# Altium schematic sheet 14V_Buck.SchDoc
size A; Author: Jared Ainsworth; CompanyName: UpRev LLC; Engineer: Jared Ainsworth; Organization: UpRev LLC; Address1: 4807 Commercial Park Dr.; Address2: Austin, TX 78724; Address3: United States; Address4: www.UpRev.com; SheetNumber: 12; SheetTotal: 13
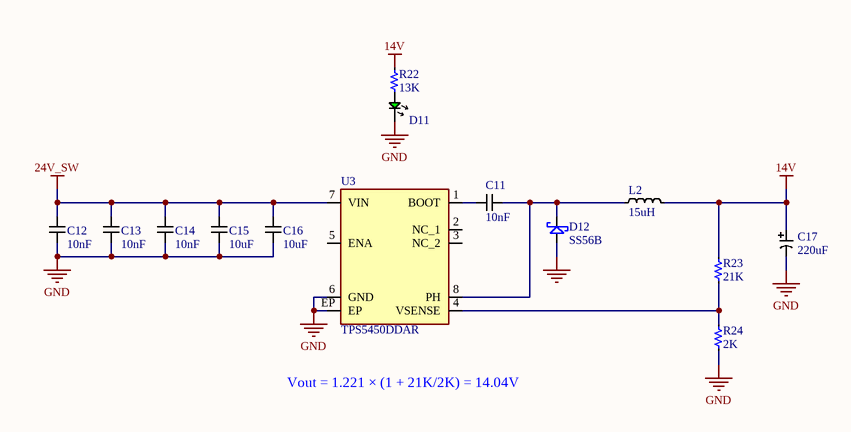
[diagram p0: 14V_Buck.SchDoc]

## Parts
C11  10nF  [C0402 (1005)]
C12  10nF  [C0402 (1005)]
C13  10nF  [C0402 (1005)]
C14  10nF  [C0402 (1005)]
C15  10uF  [C1206 (3216)]
C16  10uF  [C1206 (3216)]
C17  220uF  [Cap D10xL10.2mm]
D11  Green  [LED Green 0402 (1005)]  (value not drawn)
D12  SS56B  [DO-214AA]
L2  15uH  [Inductor 11.5x10mm SMD]
R22  13K  [R0402 (1005)]
R23  21K  [R0402 (1005)]
R24  2K  [R0402 (1005)]
U3  TPS5450DDAR  [SOP-8-EP-150mil]

## Nets
14V: C17.1(+) L2.2 R22.2 R23.2
24V_SW: C12.1 C13.1 C14.1 C15.1 C16.1 U3.7(VIN)
GND: C12.2 C13.2 C14.2 C15.2 C16.2 C17.2 D11.1(Gnd) D12.2(Anode) R24.1 U3.6(GND) U3.EP
NetC11_1: C11.1 U3.1(BOOT)
NetC11_2: C11.2 D12.1(Cathode) L2.1 U3.8(PH)
NetD11_2: D11.2(+) R22.1
NetR23_1: R23.1 R24.2 U3.4(VSENSE)

Not connected (* = marked no-connect by the designer): U3 2(NC_1) 3(NC_2) 5(ENA)

## Notes on the sheet
- Vout = 1.221 × (1 + 21K/2K) = 14.04V
- Title
- Size:
- Engineer:
- A
- Number:
- Revision:
- Sheet
- of
- File:

## Library data of the parts
C11-C14 = 10nF Ceramic, 50V, 0402 (1005): 10nF Ceramic Capacitor, 50V, ±10%, 0402 (1005); Manufacturer Part Number: CL05B103KB5NNNC; Manufacturer: Samsung Electro-Mechanics; Package: 0402 (1005 metric); Value: 10nF; LCSC Part Number: C15195; Footprint: 0402
C15 C16 = 10uF Ceramic, 50V, 1206 (3216): 10uF Ceramic Capacitor, 50V, ±10%, 1206 (3216); Manufacturer Part Number: CL31A106KBHNNNE; Manufacturer: Samsung Electro-Mechanics; Package: 1206 (3216 metric); Value: 10uF; LCSC Part Number: C13585
C17 = 220uF Aluminum Electrolytic, 50V, D10x10.2mm: 220uF Aluminum Electrolytic Capacitor, 50V, ±20%, D10x10.2mm; Manufacturer: DMBJ; Manufacturer Part Number: RVT1H221M1010 220UF 50V; Package: SMD,D6.3xL7.7mm; Value: 220uF; LCSC Part Number: C970698
D11 = LED Green, 0402 (1005): Manufacturer Part Number: NCD0402G1; Manufacturer: Foshan NationStar Optoelectronics; Forward Current: 20mA; Color: Green; Package: 0402; LCSC Part Number: C130723
D12 = Schottky, 5A, SS56B: Schottky Diode, 60V, 5A, DO-214AA, MDD SS56B; Manufacture: MDD(Microdiode Semiconductor); Package: SMB(DO-214AA); LCSC Part Number: C14651; Manufacturer Part Number: SS56B
L2 = 15uH 7A, 11.5x10mm: 15uH Inductor, 7A, ±20%, 11.5x10mm; Manufacturer Part Number: SMMS1040-150M; Manufacturer: SXN(Shun Xiang Nuo Elec); Package: SMD,11.5x10mm; LCSC Part Number: C149596; Value: 15uH
R22 = 13K ohm, 0402 (1005): 13K ohm, Resistor, ±1%, 0402 (1005); Manufacturer: UNI-ROYAL(Uniroyal Elec); Manufacturer Part Number: 0402WGF1302TCE; Package: 0402 (1005 metric); LCSC Part Number: C25754; Value: 13K
R23 = 21K ohm, 0402 (1005): 21K ohm, Resistor, ±1%, 0402 (1005); Manufacturer: UNI-ROYAL(Uniroyal Elec); Manufacturer Part Number: 0402WGF2102TCE; Package: 0402 (1005 metric); LCSC Part Number: C25766; Value: 21K
R24 = 2K ohm, 0402 (1005): 2K ohm, Resistor, ±1%, 0402 (1005); Manufacturer: UNI-ROYAL(Uniroyal Elec); Manufacturer Part Number: 0402WGF2001TCE; Package: 0402 (1005 metric); LCSC Part Number: C4109; Value: 2K
U3 = TPS5450DDAR: Texas Instruments switching V reg, step down, 5A wide range input TPS5450DDAR; Manufacturer Part Number: TPS5450DDAR; Manufacturer: Texas Instruments; LCSC Part Number: C114425; Package: SOP-8-EP-150mil